# Altium project adau1979-fpga.PrjPcb (part 6 of 6)
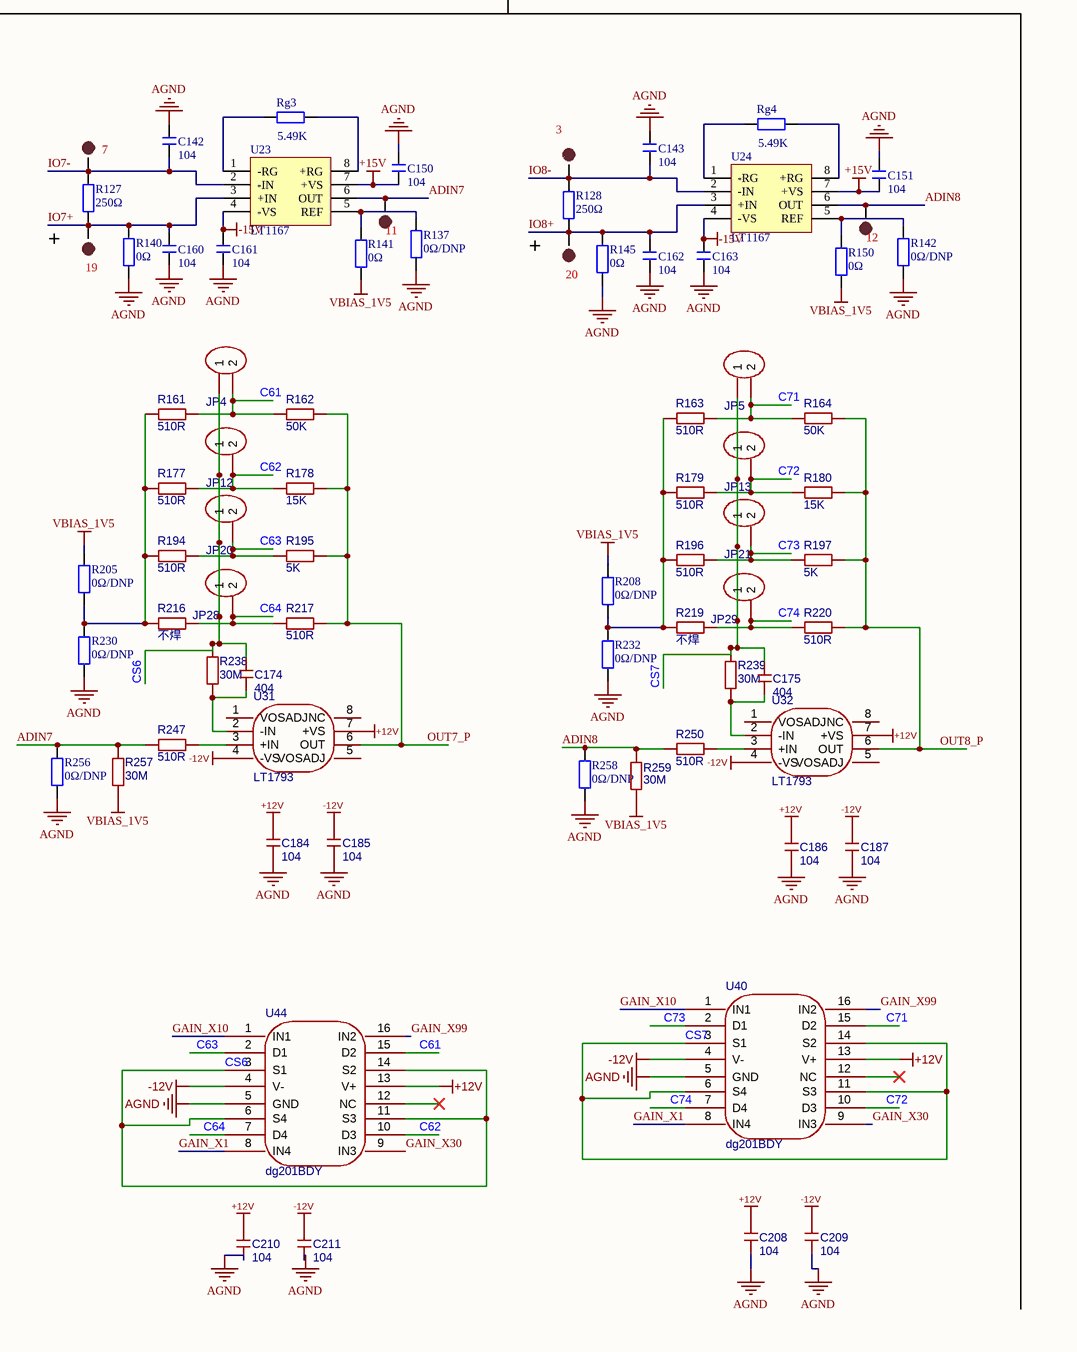
[diagram p10: adau1979_fpga.SchDoc, bottom right]

## Sheet adau1979_fpga.SchDoc (continued)

### Library data of the parts (continued)
R246 = R: 贴片电阻; 版权归属: 来自淘宝 ID：黄晶宝石; 封装库来自淘宝卖家 ID：黄晶宝石: 其他店铺购入均为盗版，不享受售后技术支持服务，请立即申请退款; Origin Footprint: R 0201_L; OriginFootprint 2: R 0402_L; OriginFootprint 3: R 0805_L; OriginFootprint 4: R 1206_L; OriginFootprint 5: R 1210_L; OriginFootprint 6: R 1812_L; OriginFootprint 7: R 2010_L; OriginFootprint 8: R 2512_L; OriginFootprint 9: R 0201_M; OriginFootprint 10: R 0402_M; OriginFootprint 11: R 0603_M; OriginFootprint 12: R 0805_M; OriginFootprint 13: R 1206_M; OriginFootprint 14: R 1210_M; OriginFootprint 15: R 1812_M; OriginFootprint 16: R 2010_M; OriginFootprint 17: R 2512_M; UniqueId: 09a288aa9d6e3d92; AddInBom: yes; OriginModelName: R 0603; Device: R; BOM名称: 贴片电阻; 联系售后: https://shop463601444.taobao.com; DesignItemID: R; LibraryName: 0.1 - 电阻-电容-电感; SymbolName: R; FootprintName: R 0603_L
R247 = R: 贴片电阻; 版权归属: 来自淘宝 ID：黄晶宝石; 封装库来自淘宝卖家 ID：黄晶宝石: 其他店铺购入均为盗版，不享受售后技术支持服务，请立即申请退款; Origin Footprint: R 0201_L; OriginFootprint 2: R 0402_L; OriginFootprint 3: R 0805_L; OriginFootprint 4: R 1206_L; OriginFootprint 5: R 1210_L; OriginFootprint 6: R 1812_L; OriginFootprint 7: R 2010_L; OriginFootprint 8: R 2512_L; OriginFootprint 9: R 0201_M; OriginFootprint 10: R 0402_M; OriginFootprint 11: R 0603_M; OriginFootprint 12: R 0805_M; OriginFootprint 13: R 1206_M; OriginFootprint 14: R 1210_M; OriginFootprint 15: R 1812_M; OriginFootprint 16: R 2010_M; OriginFootprint 17: R 2512_M; UniqueId: 7c41b6516f1c60a6; AddInBom: yes; OriginModelName: R 0603; Device: R; BOM名称: 贴片电阻; 联系售后: https://shop463601444.taobao.com; DesignItemID: R; LibraryName: 0.1 - 电阻-电容-电感; SymbolName: R; FootprintName: R 0603_L
R249 = R: 贴片电阻; 版权归属: 来自淘宝 ID：黄晶宝石; 封装库来自淘宝卖家 ID：黄晶宝石: 其他店铺购入均为盗版，不享受售后技术支持服务，请立即申请退款; Origin Footprint: R 0201_L; OriginFootprint 2: R 0402_L; OriginFootprint 3: R 0805_L; OriginFootprint 4: R 1206_L; OriginFootprint 5: R 1210_L; OriginFootprint 6: R 1812_L; OriginFootprint 7: R 2010_L; OriginFootprint 8: R 2512_L; OriginFootprint 9: R 0201_M; OriginFootprint 10: R 0402_M; OriginFootprint 11: R 0603_M; OriginFootprint 12: R 0805_M; OriginFootprint 13: R 1206_M; OriginFootprint 14: R 1210_M; OriginFootprint 15: R 1812_M; OriginFootprint 16: R 2010_M; OriginFootprint 17: R 2512_M; UniqueId: 127bceab6ada68c7; AddInBom: yes; OriginModelName: R 0603; Device: R; BOM名称: 贴片电阻; 联系售后: https://shop463601444.taobao.com; DesignItemID: R; LibraryName: 0.1 - 电阻-电容-电感; SymbolName: R; FootprintName: R 0603_L
R250 = R: 贴片电阻; 版权归属: 来自淘宝 ID：黄晶宝石; 封装库来自淘宝卖家 ID：黄晶宝石: 其他店铺购入均为盗版，不享受售后技术支持服务，请立即申请退款; Origin Footprint: R 0201_L; OriginFootprint 2: R 0402_L; OriginFootprint 3: R 0805_L; OriginFootprint 4: R 1206_L; OriginFootprint 5: R 1210_L; OriginFootprint 6: R 1812_L; OriginFootprint 7: R 2010_L; OriginFootprint 8: R 2512_L; OriginFootprint 9: R 0201_M; OriginFootprint 10: R 0402_M; OriginFootprint 11: R 0603_M; OriginFootprint 12: R 0805_M; OriginFootprint 13: R 1206_M; OriginFootprint 14: R 1210_M; OriginFootprint 15: R 1812_M; OriginFootprint 16: R 2010_M; OriginFootprint 17: R 2512_M; UniqueId: 70403c1b3b132533; AddInBom: yes; OriginModelName: R 0603; Device: R; BOM名称: 贴片电阻; 联系售后: https://shop463601444.taobao.com; DesignItemID: R; LibraryName: 0.1 - 电阻-电容-电感; SymbolName: R; FootprintName: R 0603_L
R251 = R: 贴片电阻; 版权归属: 来自淘宝 ID：黄晶宝石; 封装库来自淘宝卖家 ID：黄晶宝石: 其他店铺购入均为盗版，不享受售后技术支持服务，请立即申请退款; Origin Footprint: R 0201_L; OriginFootprint 2: R 0402_L; OriginFootprint 3: R 0805_L; OriginFootprint 4: R 1206_L; OriginFootprint 5: R 1210_L; OriginFootprint 6: R 1812_L; OriginFootprint 7: R 2010_L; OriginFootprint 8: R 2512_L; OriginFootprint 9: R 0201_M; OriginFootprint 10: R 0402_M; OriginFootprint 11: R 0603_M; OriginFootprint 12: R 0805_M; OriginFootprint 13: R 1206_M; OriginFootprint 14: R 1210_M; OriginFootprint 15: R 1812_M; OriginFootprint 16: R 2010_M; OriginFootprint 17: R 2512_M; UniqueId: c7fcac2dc179deab; AddInBom: yes; OriginModelName: R 0603; Device: R; BOM名称: 贴片电阻; 联系售后: https://shop463601444.taobao.com; DesignItemID: R; LibraryName: 0.1 - 电阻-电容-电感; SymbolName: R; FootprintName: R 0603_L
R252 = R: 贴片电阻; 版权归属: 来自淘宝 ID：黄晶宝石; 封装库来自淘宝卖家 ID：黄晶宝石: 其他店铺购入均为盗版，不享受售后技术支持服务，请立即申请退款; Origin Footprint: R 0201_L; OriginFootprint 2: R 0402_L; OriginFootprint 3: R 0805_L; OriginFootprint 4: R 1206_L; OriginFootprint 5: R 1210_L; OriginFootprint 6: R 1812_L; OriginFootprint 7: R 2010_L; OriginFootprint 8: R 2512_L; OriginFootprint 9: R 0201_M; OriginFootprint 10: R 0402_M; OriginFootprint 11: R 0603_M; OriginFootprint 12: R 0805_M; OriginFootprint 13: R 1206_M; OriginFootprint 14: R 1210_M; OriginFootprint 15: R 1812_M; OriginFootprint 16: R 2010_M; OriginFootprint 17: R 2512_M; UniqueId: 3f1747bc7cd0165c; AddInBom: yes; OriginModelName: R 0603; Device: R; BOM名称: 贴片电阻; 联系售后: https://shop463601444.taobao.com; DesignItemID: R; LibraryName: 0.1 - 电阻-电容-电感; SymbolName: R; FootprintName: R 0603_L
R253 = R: 贴片电阻; 版权归属: 来自淘宝 ID：黄晶宝石; 封装库来自淘宝卖家 ID：黄晶宝石: 其他店铺购入均为盗版，不享受售后技术支持服务，请立即申请退款; Origin Footprint: R 0201_L; OriginFootprint 2: R 0402_L; OriginFootprint 3: R 0805_L; OriginFootprint 4: R 1206_L; OriginFootprint 5: R 1210_L; OriginFootprint 6: R 1812_L; OriginFootprint 7: R 2010_L; OriginFootprint 8: R 2512_L; OriginFootprint 9: R 0201_M; OriginFootprint 10: R 0402_M; OriginFootprint 11: R 0603_M; OriginFootprint 12: R 0805_M; OriginFootprint 13: R 1206_M; OriginFootprint 14: R 1210_M; OriginFootprint 15: R 1812_M; OriginFootprint 16: R 2010_M; OriginFootprint 17: R 2512_M; UniqueId: 086d1dd8ac2c5fca; AddInBom: yes; OriginModelName: R 0603; Device: R; BOM名称: 贴片电阻; 联系售后: https://shop463601444.taobao.com; DesignItemID: R; LibraryName: 0.1 - 电阻-电容-电感; SymbolName: R; FootprintName: R 0603_L
R255 = R: 贴片电阻; 版权归属: 来自淘宝 ID：黄晶宝石; 封装库来自淘宝卖家 ID：黄晶宝石: 其他店铺购入均为盗版，不享受售后技术支持服务，请立即申请退款; Origin Footprint: R 0201_L; OriginFootprint 2: R 0402_L; OriginFootprint 3: R 0805_L; OriginFootprint 4: R 1206_L; OriginFootprint 5: R 1210_L; OriginFootprint 6: R 1812_L; OriginFootprint 7: R 2010_L; OriginFootprint 8: R 2512_L; OriginFootprint 9: R 0201_M; OriginFootprint 10: R 0402_M; OriginFootprint 11: R 0603_M; OriginFootprint 12: R 0805_M; OriginFootprint 13: R 1206_M; OriginFootprint 14: R 1210_M; OriginFootprint 15: R 1812_M; OriginFootprint 16: R 2010_M; OriginFootprint 17: R 2512_M; UniqueId: 0b6333695f921556; AddInBom: yes; OriginModelName: R 0603; Device: R; BOM名称: 贴片电阻; 联系售后: https://shop463601444.taobao.com; DesignItemID: R; LibraryName: 0.1 - 电阻-电容-电感; SymbolName: R; FootprintName: R 0603_L
R257 = R: 贴片电阻; 版权归属: 来自淘宝 ID：黄晶宝石; 封装库来自淘宝卖家 ID：黄晶宝石: 其他店铺购入均为盗版，不享受售后技术支持服务，请立即申请退款; Origin Footprint: R 0201_L; OriginFootprint 2: R 0402_L; OriginFootprint 3: R 0805_L; OriginFootprint 4: R 1206_L; OriginFootprint 5: R 1210_L; OriginFootprint 6: R 1812_L; OriginFootprint 7: R 2010_L; OriginFootprint 8: R 2512_L; OriginFootprint 9: R 0201_M; OriginFootprint 10: R 0402_M; OriginFootprint 11: R 0603_M; OriginFootprint 12: R 0805_M; OriginFootprint 13: R 1206_M; OriginFootprint 14: R 1210_M; OriginFootprint 15: R 1812_M; OriginFootprint 16: R 2010_M; OriginFootprint 17: R 2512_M; UniqueId: 79cad709e969d650; AddInBom: yes; OriginModelName: R 0603; Device: R; BOM名称: 贴片电阻; 联系售后: https://shop463601444.taobao.com; DesignItemID: R; LibraryName: 0.1 - 电阻-电容-电感; SymbolName: R; FootprintName: R 0603_L
R259 = R: 贴片电阻; 版权归属: 来自淘宝 ID：黄晶宝石; 封装库来自淘宝卖家 ID：黄晶宝石: 其他店铺购入均为盗版，不享受售后技术支持服务，请立即申请退款; Origin Footprint: R 0201_L; OriginFootprint 2: R 0402_L; OriginFootprint 3: R 0805_L; OriginFootprint 4: R 1206_L; OriginFootprint 5: R 1210_L; OriginFootprint 6: R 1812_L; OriginFootprint 7: R 2010_L; OriginFootprint 8: R 2512_L; OriginFootprint 9: R 0201_M; OriginFootprint 10: R 0402_M; OriginFootprint 11: R 0603_M; OriginFootprint 12: R 0805_M; OriginFootprint 13: R 1206_M; OriginFootprint 14: R 1210_M; OriginFootprint 15: R 1812_M; OriginFootprint 16: R 2010_M; OriginFootprint 17: R 2512_M; UniqueId: d1ab67904d4ab3e5; AddInBom: yes; OriginModelName: R 0603; Device: R; BOM名称: 贴片电阻; 联系售后: https://shop463601444.taobao.com; DesignItemID: R; LibraryName: 0.1 - 电阻-电容-电感; SymbolName: R; FootprintName: R 0603_L
R260 = R: 贴片电阻; 版权归属: 来自淘宝 ID：黄晶宝石; 封装库来自淘宝卖家 ID：黄晶宝石: 其他店铺购入均为盗版，不享受售后技术支持服务，请立即申请退款; Origin Footprint: R 0201_L; OriginFootprint 2: R 0402_L; OriginFootprint 3: R 0805_L; OriginFootprint 4: R 1206_L; OriginFootprint 5: R 1210_L; OriginFootprint 6: R 1812_L; OriginFootprint 7: R 2010_L; OriginFootprint 8: R 2512_L; OriginFootprint 9: R 0201_M; OriginFootprint 10: R 0402_M; OriginFootprint 11: R 0603_M; OriginFootprint 12: R 0805_M; OriginFootprint 13: R 1206_M; OriginFootprint 14: R 1210_M; OriginFootprint 15: R 1812_M; OriginFootprint 16: R 2010_M; OriginFootprint 17: R 2512_M; UniqueId: 9e71ce6b7342da3b; AddInBom: yes; OriginModelName: R 0603; Device: R; BOM名称: 贴片电阻; 联系售后: https://shop463601444.taobao.com; DesignItemID: R; LibraryName: 0.1 - 电阻-电容-电感; SymbolName: R; FootprintName: R 0603_L
R262 = R: 贴片电阻; 版权归属: 来自淘宝 ID：黄晶宝石; 封装库来自淘宝卖家 ID：黄晶宝石: 其他店铺购入均为盗版，不享受售后技术支持服务，请立即申请退款; Origin Footprint: R 0201_L; OriginFootprint 2: R 0402_L; OriginFootprint 3: R 0805_L; OriginFootprint 4: R 1206_L; OriginFootprint 5: R 1210_L; OriginFootprint 6: R 1812_L; OriginFootprint 7: R 2010_L; OriginFootprint 8: R 2512_L; OriginFootprint 9: R 0201_M; OriginFootprint 10: R 0402_M; OriginFootprint 11: R 0603_M; OriginFootprint 12: R 0805_M; OriginFootprint 13: R 1206_M; OriginFootprint 14: R 1210_M; OriginFootprint 15: R 1812_M; OriginFootprint 16: R 2010_M; OriginFootprint 17: R 2512_M; UniqueId: f7952e9f9cd6773b; AddInBom: yes; OriginModelName: R 0603; Device: R; BOM名称: 贴片电阻; 联系售后: https://shop463601444.taobao.com; DesignItemID: R; LibraryName: 0.1 - 电阻-电容-电感; SymbolName: R; FootprintName: R 0603_L
R264 = R: 贴片电阻; 版权归属: 来自淘宝 ID：黄晶宝石; 封装库来自淘宝卖家 ID：黄晶宝石: 其他店铺购入均为盗版，不享受售后技术支持服务，请立即申请退款; Origin Footprint: R 0201_L; OriginFootprint 2: R 0402_L; OriginFootprint 3: R 0805_L; OriginFootprint 4: R 1206_L; OriginFootprint 5: R 1210_L; OriginFootprint 6: R 1812_L; OriginFootprint 7: R 2010_L; OriginFootprint 8: R 2512_L; OriginFootprint 9: R 0201_M; OriginFootprint 10: R 0402_M; OriginFootprint 11: R 0603_M; OriginFootprint 12: R 0805_M; OriginFootprint 13: R 1206_M; OriginFootprint 14: R 1210_M; OriginFootprint 15: R 1812_M; OriginFootprint 16: R 2010_M; OriginFootprint 17: R 2512_M; UniqueId: ee084f684bde39fa; AddInBom: yes; OriginModelName: R 0603; Device: R; BOM名称: 贴片电阻; 联系售后: https://shop463601444.taobao.com; DesignItemID: R; LibraryName: 0.1 - 电阻-电容-电感; SymbolName: R; FootprintName: R 0603_L
R266 = R: 贴片电阻; 版权归属: 来自淘宝 ID：黄晶宝石; 封装库来自淘宝卖家 ID：黄晶宝石: 其他店铺购入均为盗版，不享受售后技术支持服务，请立即申请退款; Origin Footprint: R 0201_L; OriginFootprint 2: R 0402_L; OriginFootprint 3: R 0805_L; OriginFootprint 4: R 1206_L; OriginFootprint 5: R 1210_L; OriginFootprint 6: R 1812_L; OriginFootprint 7: R 2010_L; OriginFootprint 8: R 2512_L; OriginFootprint 9: R 0201_M; OriginFootprint 10: R 0402_M; OriginFootprint 11: R 0603_M; OriginFootprint 12: R 0805_M; OriginFootprint 13: R 1206_M; OriginFootprint 14: R 1210_M; OriginFootprint 15: R 1812_M; OriginFootprint 16: R 2010_M; OriginFootprint 17: R 2512_M; UniqueId: 2eb3813281b987ab; AddInBom: yes; OriginModelName: R 0603; Device: R; BOM名称: 贴片电阻; 联系售后: https://shop463601444.taobao.com; DesignItemID: R; LibraryName: 0.1 - 电阻-电容-电感; SymbolName: R; FootprintName: R 0603_L
R268 = R: 贴片电阻; 版权归属: 来自淘宝 ID：黄晶宝石; 封装库来自淘宝卖家 ID：黄晶宝石: 其他店铺购入均为盗版，不享受售后技术支持服务，请立即申请退款; Origin Footprint: R 0201_L; OriginFootprint 2: R 0402_L; OriginFootprint 3: R 0805_L; OriginFootprint 4: R 1206_L; OriginFootprint 5: R 1210_L; OriginFootprint 6: R 1812_L; OriginFootprint 7: R 2010_L; OriginFootprint 8: R 2512_L; OriginFootprint 9: R 0201_M; OriginFootprint 10: R 0402_M; OriginFootprint 11: R 0603_M; OriginFootprint 12: R 0805_M; OriginFootprint 13: R 1206_M; OriginFootprint 14: R 1210_M; OriginFootprint 15: R 1812_M; OriginFootprint 16: R 2010_M; OriginFootprint 17: R 2512_M; UniqueId: fa394caafc8878d8; AddInBom: yes; OriginModelName: R 0603; Device: R; BOM名称: 贴片电阻; 联系售后: https://shop463601444.taobao.com; DesignItemID: R; LibraryName: 0.1 - 电阻-电容-电感; SymbolName: R; FootprintName: R 0603_L
SW1 = SW-1P: 1路编码开关; 学习资源: 封装库来自淘宝 ID：黄晶宝石; BOM名称: 1路编码开关; 技术支持，联系售后: https://shop463601444.taobao.com
SW2 = 2MS1T2B2VS2QES: BOM_Manufacturer: Dailywell; Contributor: LCSC; BOM_Supplier: LCSC; BOM_Supplier Part: C545202; BOM_Manufacturer Part: 2MS1T2B2VS2QES; BOM_JLCPCB Part Class: Extended Part; spicePre: S; spiceSymbolName: 2MS1T2B2VS2QES
SW4 = TSW SMD-6x6: BOM名称: 贴片6x6轻触开关; 版权归属: 封装库来自淘宝 ID：黄晶宝石; 唯一出售店铺网址: https://shop463601444.taobao.com
U1 = TPS7A4701: Origin Footprint: VQFN-20_L5.0-W5.0-P0.65-TL-EP; OriginFootprint 2: VQFN; AddInBom: yes; Device: TPS7A4701; DesignItemID: TPS7A4701; LibraryName: 1.1 - 电源类芯片; Symbol: TPS7A4701; FootprintName: PCBComponent_1
U2 = TPS7A3301RGWR: Manufacturer: TI(德州仪器); Add into BOM: yes; Output Type: 可调; Voltage - Supply: 35V; Output Voltage: 1.175V~33.2V; Output Current: 1A; Power Supply Rejection Ratio (PSRR): 72dB@(10kHz); Voltage Dropout: 290mV@(500mA); standby current: 210uA; Noise: 16uVrms; Output Configuration: 负极; Number of Outputs: 1; Origin Footprint: VQFN-20_L5.0-W5.0-P0.65-TL-EP; Device: TPS7A3301RGWR; LCSC Part Name: 具有使能功能的 1A、高 PSRR、负电压、可调节低压降稳压器; Supplier Part: C90082; Manufacturer Part: TPS7A3301RGWR; Supplier Footprint: VQFN-20-EP(5x5); JLCPCB Part Class: Extended Part; Datasheet: https://www.ti.com/cn/lit/gpn/tps7a33; Supplier: LCSC; Convert to PCB: yes; Features: 欠压锁定；过流保护；带使能；过热保护; Operating Temperature: -40℃~+125℃@(Tj); OriginFootprint 2: VQFN-20_L5.0-W5.0-P0.65-TL-EP; DesignItemID: TPS7A3301RGWR; LibraryName: TPS7A3301RGWR1_TPS7A3301RGWR; Symbol: TPS7A3301RGWR; FootprintName: PCBComponent_1
U6 = ref2030aiddcr: 输出类型:固定;工作电压:3.02V~5.5V;输出电压:3V;输出电流:20mA;精度:±0.05%;; Manufacturer: TI(德州仪器); AddInBom: yes; ModelId: 018c57e721114987ae90467fe9f1d259; ModelTransform: 114.96,110.236,0,0,0,0,0,0,0; Output Type: 固定; Output Voltage: 3V; Output Current: 20mA; Tolerance: ±0.05%; Temperature Coefficient: 8ppm/℃; Reference Type: 串联; Quiescent Current: 460uA; Noise - 1/10Hz to 10Hz: 12ppmp-p; Symbol: REF2030AIDDCR; LCSC Part Name: 3.02V~5.5V 串联 460uA 8ppm/℃; SupplierPart: C528704; ManufacturerPart: REF2030AIDDCR; Supplier Footprint: SOT-23-5; JLCPCB Part Class: Extended Part; Datasheet: https://www.ti.com/cn/lit/ds/symlink/ref2030.pdf; Supplier: LCSC; ConvertToPcb: yes; FootprintName: SOT-23-5_L2.9-W1.6-P0.95-LS2.8-BL; ModelName: SOT-23-5_L2.9-W1.6-P0.95-LS2.8-BL; Voltage - Supply: 3.02V~5.5V; Minimum Cathode Current for Regulation: -; Noise - 10Hz to 10kHz: -; Operating Temperature: -40℃~+125℃; Features: 使能/关断；内置输出缓冲；多路参考输出
U7 = opa192idbvr: 放大器数:单路;增益带宽积(GBP):10MHz;输入偏置电流(Ib):5pA;输入失调电压(Vos):5uV;压摆率(SR):20V/us;轨到轨:轨到轨输入,轨到轨输出;; Manufacturer: TI(德州仪器); AddInBom: yes; ModelId: 0a2a1b8f50944f73965918ad6e5fe167; ModelName: SOT-23-5_L2.9-W1.6-H1.1-LS2.8-P0.95; ModelTransform: 118.60433,114.173,0,90,0,0,0.0005,0.0005,0; Number of Channels: 单路; Gain Bandwidth Product: 10MHz; Ib - Input Bias Current: 5pA; Vos - Input Offset Voltage: 5uV; Common Mode Rejection Ratio(CMRR): 140dB; Slew Rate: 20V/us; Output Current: 65mA; Input Offset Voltage Drift(Vos TC): 200nV/℃; Quiescent Current(Iq): 1mA; Single Supply: 4.5V~36V; Dual Supply: -18V~-2.25V；2.25V~18V; Maximum Power Supply Range (Vdd-Vss): 36V; Noise density(eN): 5.5nV/√Hz@1kHz; Input Offset Current(Ios): 2pA; Symbol: OPA192IDBVR; LCSC Part Name: 36V低失调电压、低输入偏置电流、轨到轨输入/输出精密运算放大器，具有e-trim特性; SupplierPart: C139648; ManufacturerPart: OPA192IDBVR; Supplier Footprint: SOT-23-5; JLCPCB Part Class: Extended Part; Datasheet: https://www.ti.com/cn/lit/gpn/opa192; Supplier: LCSC; ConvertToPcb: yes; FootprintName: SOT-23-5_L3.0-W1.7-P0.95-LS2.8-BL; Rail to Rail: 轨到轨输入,轨到轨输出; Operating Temperature: -40℃~+125℃
U8 = ura2412s-6wr3_c2757452: 特性：超宽4:1输入电压范围。 高效率达85%。 空载功耗低至0.24W。 I/O隔离测试电压1.5kV DC。 输入欠压保护，输出短路、过流保护。 工作环境温度范围：-40℃至+85℃。应用：医疗保健。 工业控制; Manufacturer: MORNSUN(金升阳); AddInBom: yes; ModelId: 59ee18447e164eb5803ce5c0826121e9; ModelTransform: 866.14,374.015,0,0,0,0,0,-81.299,-161.417; Number of Outputs: 2; Output Power: 6W; Voltage - Supply: 9V~36V; Conversion Efficiency: 83%; Output Voltage: ±12V; Output Current(Max): 250mA; Capacitive Load(Max): 120uF; Isolation Voltage(Vrms): 1.5kV; Value: 500kHz; Ripple Noise: 120mVp-p; Symbol: URA2412S-6WR3_C2757452; LCSC Part Name: 9V~36V ±12V 250mA 6W; SupplierPart: C2757452; ManufacturerPart: URA2412S-6WR3; Supplier Footprint: SIP,22x9.5mm; JLCPCB Part Class: Extended Part; Datasheet: https://item.szlcsc.com/datasheet/URA2412S-6WR3/2873721.html; Supplier: LCSC; ConvertToPcb: yes; FootprintName: PWRM-TH_URAXXXXS-6WR3; ModelName: PWRM-TH_URAXXXXS-6WR3; Type: -; Features: 欠压保护；短路保护；过流保护；轻载高效模式; Operating Temperature: -40℃~+85℃; Quiescent Supply Current: -; Length: 22mm; Width: 9.5mm; Height: 12mm; Voltage Regulation: -
U9 = pc817x2csp9f: 输入类型:DC;正向压降(Vf):1.2V;输出电流:50mA;隔离电压(Vrms):5kV;直流反向耐压(Vr):6V;负载电压:80V;输出通道数:-;集射极饱和电压(VCE(sat)):200mV@20mA,1mA;; Manufacturer: SHARP(夏普); AddInBom: yes; ModelId: 991879f0d3e24dbd9895164815fb95aa; ModelName: SMD-4_L4.6-W6.5-H3.7-LS10.2-P2.54; ModelTransform: 401.94494,181.102,0,0,0,0,0,0.003,0; Input type: DC; Output Type: 光电三极管; Voltage - Forward(Vf): 1.2V; Output Current: 50mA; Isolation Voltage(Vrms): 5kV; Reverse Voltage: 6V; Load Voltage: 80V; Rise time: 4us; Fall time: 3us; Current Transfer Ratio (CTR) Minimum: 50%; Current Transfer Ratio (CTR) Maximum/Saturation Value: 600%; Total Power Dissipation(Pd): 200mW; Symbol: PC817X2CSP9F; LCSC Part Name: DC输入 隔离电压(rms):5000V; SupplierPart: C66405; ManufacturerPart: PC817X2CSP9F; Supplier Footprint: SMD-4P; JLCPCB Part Class: Extended Part; Datasheet: https://item.szlcsc.com/datasheet/PC817X2CSP9F/67489.html; Supplier: LCSC; ConvertToPcb: yes; FootprintName: SMD-4_L4.6-W6.5-P2.54-LS10.2-TL; Number of Outputs: -; Vce Saturation(VCE(sat)): 200mV@20mA,1mA; Operating Temperature: -30℃~+100℃; Forward Current(If): 50mA
U10 = lp5907mfx-3.3/nopb: 输出极性:正极;工作电压:5.5V;输出电压:3.3V;输出电流:250mA;电源纹波抑制比(PSRR):82dB@(1kHz);输出类型:固定;; Manufacturer: TI(德州仪器); AddInBom: yes; ModelId: 0a2a1b8f50944f73965918ad6e5fe167; ModelName: SOT-23-5_L2.9-W1.6-H1.1-LS2.8-P0.95; ModelTransform: 114.173,109.636,0,180,0,0,0,0,0; Output Configuration: 正极; Voltage - Supply: 5.5V; Output Voltage: 3.3V; Output Current: 250mA; Voltage Dropout: 250mV@(250mA); standby current: 12uA; Noise: 10uVrms; Output Type: 固定; Number of Outputs: 1; Symbol: LP5907MFX-3.3/NOPB; LCSC Part Name: 3.3V 250mA 5.5V; SupplierPart: C80670; ManufacturerPart: LP5907MFX-3.3/NOPB; Supplier Footprint: SOT-23-5; JLCPCB Part Class: Extended Part; Datasheet: https://www.ti.com/cn/lit/ds/symlink/lp5907.pdf; Supplier: LCSC; ConvertToPcb: yes; FootprintName: SOT-23-5_L3.0-W1.7-P0.95-LS2.8-BR; Power Supply Rejection Ratio (PSRR): 82dB@(1kHz); Features: 热关断；使能控制；输出放电；短路保护；输入欠压保护; Operating Temperature: -40℃~+125℃@(Tj)
U11 = AMS1117-3.3_C6186: Manufacturer: AMS; Add into BOM: yes; Output Type: 固定; Output Voltage: 3.3V; MAX Output Current: 1A; Power Supply Rejection Ratio (PSRR): 72dB@(120Hz); Dropout Voltage: 1.3V@(800mA); Output Polarity: 正极; Number of Outputs: 1; Symbol: AMS1117-3.3; Device: AMS1117-3.3_C6186; LCSC Part Name: 输出3.3V 1A; Supplier Part: C6186; Manufacturer Part: AMS1117-3.3; Supplier Footprint: SOT-223-3; JLCPCB Part Class: Basic Part; Datasheet: https://atta.szlcsc.com/upload/public/pdf/source/20180727/C6186_7A095716F0823C02F1997A905E26C086.pdf; Supplier: LCSC; Convert to PCB: yes; Maximum Input Voltage: -; standby current: -; Noise: -; Feature: -; Operating Temperature: -
U12 U17 = adau1979wbcpz-rl: 分辨率:24;工作电压:3.3V~3.6V;接口类型:I2C；SPI;; Manufacturer: ADI(亚德诺); AddInBom: yes; ModelId: 7c9bc19ca4c64354924a13059f0c15c7; ModelTransform: 237.007,237.007,0,0,0,0,0,0,0; Resolution: 24; Number of Channels: 4; Symbol: ADAU1979WBCPZ-RL; LCSC Part Name: 四通道模数转换器(ADC); SupplierPart: C207957; ManufacturerPart: ADAU1979WBCPZ-RL; Supplier Footprint: LFCSP-40(6x6); JLCPCB Part Class: Extended Part; Datasheet: https://item.szlcsc.com/datasheet/ADAU1979WBCPZ-RL/209011.html; Supplier: LCSC; ConvertToPcb: yes; FootprintName: QFN-40_L6.0-W6.0-P0.50-TL-EP4.1; ModelName: QFN-40_L6.0-W6.0-P0.50-TL-EP4.1; Voltage - Supply: 3.3V~3.6V; Interface Type: I2C；SPI; Operating Temperature: -40℃~+105℃
U13 = ura2415ymd-15wr3: 特性：超宽4:1输入电压范围。高效率达90%。空载功耗低至0.24W。I/O隔离测试电压1.5kV DC。输入欠压保护、输出短路、过流、过压保护。工作环境温度范围：-40℃至+105℃。应用：工业控制。电力; Manufacturer: MORNSUN(金升阳); Symbol: URA2415YMD-15WR3_C5182197; AddInBom: yes; LCSC Part Name: 15W 隔离式 DC-DC 转换器; SupplierPart: C5182197; ManufacturerPart: URA2415YMD-15WR3; Supplier Footprint: DIP,25.4x25.4mm; JLCPCB Part Class: Extended Part; Datasheet: https://item.szlcsc.com/datasheet/URA2415YMD-15WR3/5842586.html; Supplier: LCSC; ConvertToPcb: yes; FootprintName: PWRM-TH_URA2415YMD-15WR3
U14 = TJA1057GT3_8P: CLASS: IC
U18 = TJA1057GT3: CLASS: IC
U21-U28 = AD620BR: CI-AD620BR
U29 = LT1793: LT1793CS8#PBF; UniqueId: b94fd32bcc95872d; AddInBom: yes; OriginModelName: User Library-so-8; Device: LT1793; DesignItemID: LT1793; LibraryName: 1.6 - ADI系列精密运放; SymbolName: LT1793; FootprintName: SOP-8
U30 = LT1793: LT1793CS8#PBF; UniqueId: 2c27b242a2875aaf; AddInBom: yes; OriginModelName: User Library-so-8; Device: LT1793; DesignItemID: LT1793; LibraryName: 1.6 - ADI系列精密运放; SymbolName: LT1793; FootprintName: SOP-8
U31 = LT1793: LT1793CS8#PBF; UniqueId: be87043ebfc5f98d; AddInBom: yes; OriginModelName: User Library-so-8; Device: LT1793; DesignItemID: LT1793; LibraryName: 1.6 - ADI系列精密运放; SymbolName: LT1793; FootprintName: SOP-8
U32 = LT1793: LT1793CS8#PBF; UniqueId: 03a1f9b1f2129ca8; AddInBom: yes; OriginModelName: User Library-so-8; Device: LT1793; DesignItemID: LT1793; LibraryName: 1.6 - ADI系列精密运放; SymbolName: LT1793; FootprintName: SOP-8
U33 = LT1793: LT1793CS8#PBF; UniqueId: 4ec783ed4741de1f; AddInBom: yes; OriginModelName: User Library-so-8; Device: LT1793; DesignItemID: LT1793; LibraryName: 1.6 - ADI系列精密运放; SymbolName: LT1793; FootprintName: SOP-8
U34 = LT1793: LT1793CS8#PBF; UniqueId: 484e3008dca2bfa8; AddInBom: yes; OriginModelName: User Library-so-8; Device: LT1793; DesignItemID: LT1793; LibraryName: 1.6 - ADI系列精密运放; SymbolName: LT1793; FootprintName: SOP-8
U35 = LT1793: LT1793CS8#PBF; UniqueId: 2dbbb3175ebf36d7; AddInBom: yes; OriginModelName: User Library-so-8; Device: LT1793; DesignItemID: LT1793; LibraryName: 1.6 - ADI系列精密运放; SymbolName: LT1793; FootprintName: SOP-8
U36 = LT1793: LT1793CS8#PBF; UniqueId: 124c013cfc851acc; AddInBom: yes; OriginModelName: User Library-so-8; Device: LT1793; DesignItemID: LT1793; LibraryName: 1.6 - ADI系列精密运放; SymbolName: LT1793; FootprintName: SOP-8
U37 = DG201BDY-T1E3: UniqueId: 6151f2f354ad58a1; AddInBom: yes; Device: DG201BDY-T1E3; DesignItemID: DG201BDY-T1E3; LibraryName: 4.1 - 未分类器件; SymbolName: DG201BDY-T1E3; FootprintName: dg201BDY
U38 = DG201BDY-T1E3: UniqueId: ea6c5e45b64ed132; AddInBom: yes; Device: DG201BDY-T1E3; DesignItemID: DG201BDY-T1E3; LibraryName: 4.1 - 未分类器件; SymbolName: DG201BDY-T1E3; FootprintName: dg201BDY
U39 = DG201BDY-T1E3: UniqueId: 6e245fde712204fc; AddInBom: yes; Device: DG201BDY-T1E3; DesignItemID: DG201BDY-T1E3; LibraryName: 4.1 - 未分类器件; SymbolName: DG201BDY-T1E3; FootprintName: dg201BDY
U40 = DG201BDY-T1E3: UniqueId: ca4d2b64b6ec8380; AddInBom: yes; Device: DG201BDY-T1E3; DesignItemID: DG201BDY-T1E3; LibraryName: 4.1 - 未分类器件; SymbolName: DG201BDY-T1E3; FootprintName: dg201BDY
U41 = DG201BDY-T1E3: UniqueId: 4bb3335060f18692; AddInBom: yes; Device: DG201BDY-T1E3; DesignItemID: DG201BDY-T1E3; LibraryName: 4.1 - 未分类器件; SymbolName: DG201BDY-T1E3; FootprintName: dg201BDY
U42 = DG201BDY-T1E3: UniqueId: 1bdc0ab44f99f92d; AddInBom: yes; Device: DG201BDY-T1E3; DesignItemID: DG201BDY-T1E3; LibraryName: 4.1 - 未分类器件; SymbolName: DG201BDY-T1E3; FootprintName: dg201BDY
U43 = DG201BDY-T1E3: UniqueId: c69de7c088414df5; AddInBom: yes; Device: DG201BDY-T1E3; DesignItemID: DG201BDY-T1E3; LibraryName: 4.1 - 未分类器件; SymbolName: DG201BDY-T1E3; FootprintName: dg201BDY
U44 = DG201BDY-T1E3: UniqueId: 28995c53ef78d865; AddInBom: yes; Device: DG201BDY-T1E3; DesignItemID: DG201BDY-T1E3; LibraryName: 4.1 - 未分类器件; SymbolName: DG201BDY-T1E3; FootprintName: dg201BDY
USBC1 = TYPE-C-31-M-12: Manufacturer: 韩国韩荣; Add into BOM: yes; Connector Type: Type-C; Gender: 母; Number of Contacts: 16P; Number of Ports: 1; Current Rating-Power: 5A; Symbol: TYPE-C-31-M-12; Device: TYPE-C-31-M-12; LCSC Part Name: Type-C 母; Supplier Part: C165948; Manufacturer Part: TYPE-C-31-M-12; Supplier Footprint: SMD; JLCPCB Part Class: Extended Part; Datasheet: https://item.szlcsc.com/datasheet/TYPE-C-31-M-12/177331.html; Supplier: LCSC; Convert to PCB: yes; Protocol Standard: -; Mounting Type: -; Operating Temperature: -
Y1 = CRYSTAL_4P: CLASS: IC